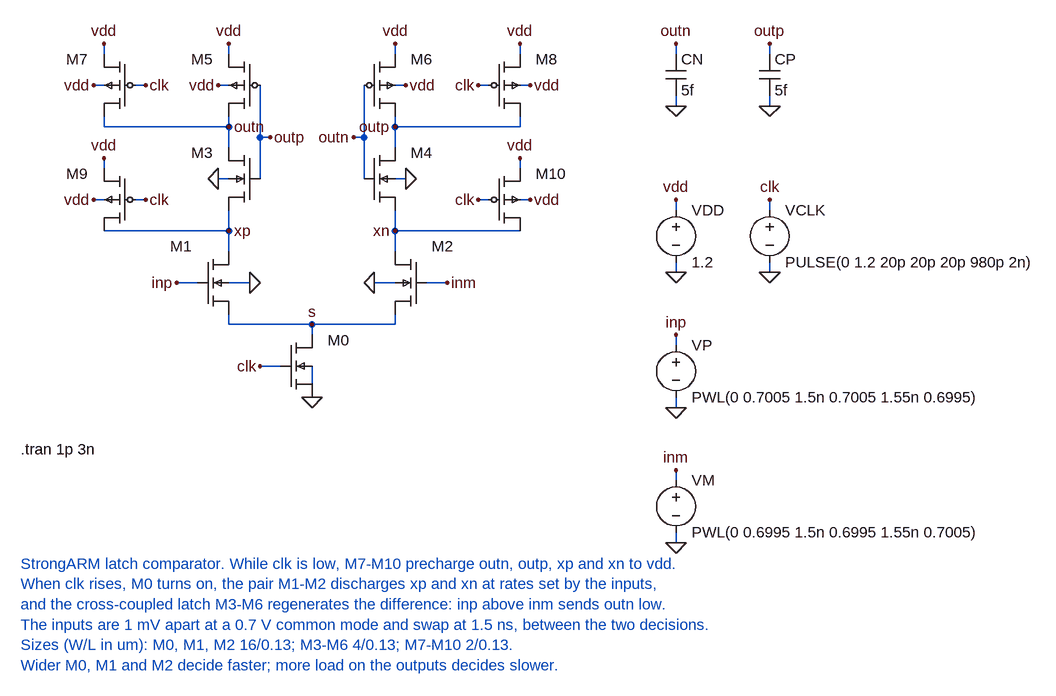
[diagram p0: schematic comparator.asc]
comparator.asc, the LTspice schematic file:
Version 4
SHEET 1 1600 1100
WIRE 368 96 368 80
WIRE 368 144 352 144
WIRE 368 288 352 288
WIRE 624 96 624 80
WIRE 624 144 640 144
WIRE 624 288 640 288
WIRE 368 192 368 240
WIRE 624 192 624 240
WIRE 416 144 416 288
WIRE 576 144 576 288
WIRE 416 224 432 224
WIRE 576 224 560 224
WIRE 320 448 288 448
WIRE 368 448 400 448
WIRE 672 448 704 448
WIRE 624 448 592 448
WIRE 368 336 368 400
WIRE 624 336 624 400
WIRE 368 496 368 512
WIRE 368 512 624 512
WIRE 624 512 624 496
WIRE 448 576 416 576
WIRE 496 528 496 512
WIRE 496 576 496 624
WIRE 176 96 176 80
WIRE 176 144 160 144
WIRE 224 144 240 144
WIRE 176 272 176 256
WIRE 176 320 160 320
WIRE 224 320 240 320
WIRE 816 96 816 80
WIRE 816 144 832 144
WIRE 768 144 752 144
WIRE 816 272 816 256
WIRE 816 320 832 320
WIRE 768 320 752 320
WIRE 176 192 176 208
WIRE 176 208 368 208
WIRE 816 192 816 208
WIRE 816 208 624 208
WIRE 176 368 368 368
WIRE 816 368 624 368
WIRE 1056 96 1056 80
WIRE 1056 160 1056 176
WIRE 1200 96 1200 80
WIRE 1200 160 1200 176
WIRE 1056 336 1056 320
WIRE 1056 416 1056 432
WIRE 1200 336 1200 320
WIRE 1200 416 1200 432
WIRE 1056 544 1056 528
WIRE 1056 624 1056 640
WIRE 1056 752 1056 736
WIRE 1056 832 1056 848
FLAG 368 80 vdd
FLAG 352 144 vdd
FLAG 352 288 0
FLAG 624 80 vdd
FLAG 640 144 vdd
FLAG 640 288 0
FLAG 432 224 outp
FLAG 560 224 outn
FLAG 288 448 inp
FLAG 400 448 0
FLAG 704 448 inm
FLAG 592 448 0
FLAG 416 576 clk
FLAG 496 512 s
FLAG 496 624 0
FLAG 176 80 vdd
FLAG 160 144 vdd
FLAG 240 144 clk
FLAG 176 256 vdd
FLAG 160 320 vdd
FLAG 240 320 clk
FLAG 816 80 vdd
FLAG 832 144 vdd
FLAG 752 144 clk
FLAG 816 256 vdd
FLAG 832 320 vdd
FLAG 752 320 clk
FLAG 368 208 outn
FLAG 624 208 outp
FLAG 368 368 xp
FLAG 624 368 xn
FLAG 1056 80 outn
FLAG 1056 176 0
FLAG 1200 80 outp
FLAG 1200 176 0
FLAG 1056 320 vdd
FLAG 1056 432 0
FLAG 1200 320 clk
FLAG 1200 432 0
FLAG 1056 528 inp
FLAG 1056 640 0
FLAG 1056 736 inm
FLAG 1056 848 0
SYMBOL sg13g2\sg13_lv_pmos 416 96 M0
WINDOW 0 72 8 Left 2
WINDOW 3 0 0 Invisible 2
WINDOW 39 0 0 Invisible 2
SYMATTR InstName M5
SYMATTR SpiceLine w=4u l=0.13u ng=1 m=1
SYMBOL sg13g2\sg13_lv_nmos 416 240 M0
WINDOW 0 72 8 Left 2
WINDOW 3 0 0 Invisible 2
WINDOW 39 0 0 Invisible 2
SYMATTR InstName M3
SYMATTR SpiceLine w=4u l=0.13u ng=1 m=1
SYMBOL sg13g2\sg13_lv_pmos 576 96 R0
WINDOW 0 72 8 Left 2
WINDOW 3 0 0 Invisible 2
WINDOW 39 0 0 Invisible 2
SYMATTR InstName M6
SYMATTR SpiceLine w=4u l=0.13u ng=1 m=1
SYMBOL sg13g2\sg13_lv_nmos 576 240 R0
WINDOW 0 72 8 Left 2
WINDOW 3 0 0 Invisible 2
WINDOW 39 0 0 Invisible 2
SYMATTR InstName M4
SYMATTR SpiceLine w=4u l=0.13u ng=1 m=1
SYMBOL sg13g2\sg13_lv_nmos 320 400 R0
WINDOW 0 -8 -8 Right 2
WINDOW 3 0 0 Invisible 2
WINDOW 39 0 0 Invisible 2
SYMATTR InstName M1
SYMATTR SpiceLine w=16u l=0.13u ng=2 m=1
SYMBOL sg13g2\sg13_lv_nmos 672 400 M0
WINDOW 0 -8 -8 Right 2
WINDOW 3 0 0 Invisible 2
WINDOW 39 0 0 Invisible 2
SYMATTR InstName M2
SYMATTR SpiceLine w=16u l=0.13u ng=2 m=1
SYMBOL sg13g2\sg13_lv_nmos 448 528 R0
WINDOW 0 72 8 Left 2
WINDOW 3 0 0 Invisible 2
WINDOW 39 0 0 Invisible 2
SYMATTR InstName M0
SYMATTR SpiceLine w=16u l=0.13u ng=2 m=1
SYMBOL sg13g2\sg13_lv_pmos 224 96 M0
WINDOW 0 72 8 Left 2
WINDOW 3 0 0 Invisible 2
WINDOW 39 0 0 Invisible 2
SYMATTR InstName M7
SYMATTR SpiceLine w=2u l=0.13u ng=1 m=1
SYMBOL sg13g2\sg13_lv_pmos 224 272 M0
WINDOW 0 72 8 Left 2
WINDOW 3 0 0 Invisible 2
WINDOW 39 0 0 Invisible 2
SYMATTR InstName M9
SYMATTR SpiceLine w=2u l=0.13u ng=1 m=1
SYMBOL sg13g2\sg13_lv_pmos 768 96 R0
WINDOW 0 72 8 Left 2
WINDOW 3 0 0 Invisible 2
WINDOW 39 0 0 Invisible 2
SYMATTR InstName M8
SYMATTR SpiceLine w=2u l=0.13u ng=1 m=1
SYMBOL sg13g2\sg13_lv_pmos 768 272 R0
WINDOW 0 72 8 Left 2
WINDOW 3 0 0 Invisible 2
WINDOW 39 0 0 Invisible 2
SYMATTR InstName M10
SYMATTR SpiceLine w=2u l=0.13u ng=1 m=1
SYMBOL cap 1040 96 R0
SYMATTR InstName CN
SYMATTR Value 5f
SYMBOL cap 1184 96 R0
SYMATTR InstName CP
SYMATTR Value 5f
SYMBOL voltage 1056 320 R0
SYMATTR InstName VDD
SYMATTR Value 1.2
SYMBOL voltage 1200 320 R0
SYMATTR InstName VCLK
SYMATTR Value PULSE(0 1.2 20p 20p 20p 980p 2n)
SYMBOL voltage 1056 528 R0
SYMATTR InstName VP
SYMATTR Value PWL(0 0.7005 1.5n 0.7005 1.55n 0.6995)
SYMBOL voltage 1056 736 R0
SYMATTR InstName VM
SYMATTR Value PWL(0 0.6995 1.5n 0.6995 1.55n 0.7005)
TEXT 48 704 Left 2 !.tran 1p 3n
TEXT 48 880 Left 2 ;StrongARM latch comparator. While clk is low, M7-M10 precharge outn, outp, xp and xn to vdd.\nWhen clk rises, M0 turns on, the pair M1-M2 discharges xp and xn at rates set by the inputs,\nand the cross-coupled latch M3-M6 regenerates the difference: inp above inm sends outn low.\nThe inputs are 1 mV apart at a 0.7 V common mode and swap at 1.5 ns, between the two decisions.\nSizes (W/L in um): M0, M1, M2 16/0.13; M3-M6 4/0.13; M7-M10 2/0.13.\nWider M0, M1 and M2 decide faster; more load on the outputs decides slower.

The netlist it stands for:
* comparator.asc
XM5 outn outp vdd vdd sg13_lv_pmos w=4u l=0.13u ng=1 m=1  ; pins D G S B
XM3 outn outp xp 0 sg13_lv_nmos w=4u l=0.13u ng=1 m=1  ; pins D G S B
XM6 outp outn vdd vdd sg13_lv_pmos w=4u l=0.13u ng=1 m=1  ; pins D G S B
XM4 outp outn xn 0 sg13_lv_nmos w=4u l=0.13u ng=1 m=1  ; pins D G S B
XM1 xp inp s 0 sg13_lv_nmos w=16u l=0.13u ng=2 m=1  ; pins D G S B
XM2 xn inm s 0 sg13_lv_nmos w=16u l=0.13u ng=2 m=1  ; pins D G S B
XM0 s clk 0 0 sg13_lv_nmos w=16u l=0.13u ng=2 m=1  ; pins D G S B
XM7 outn clk vdd vdd sg13_lv_pmos w=2u l=0.13u ng=1 m=1  ; pins D G S B
XM9 xp clk vdd vdd sg13_lv_pmos w=2u l=0.13u ng=1 m=1  ; pins D G S B
XM8 outp clk vdd vdd sg13_lv_pmos w=2u l=0.13u ng=1 m=1  ; pins D G S B
XM10 xn clk vdd vdd sg13_lv_pmos w=2u l=0.13u ng=1 m=1  ; pins D G S B
CN outn 0 5f
CP outp 0 5f
VDD vdd 0 1.2
VCLK clk 0 PULSE(0 1.2 20p 20p 20p 980p 2n)
VP inp 0 PWL(0 0.7005 1.5n 0.7005 1.55n 0.6995)
VM inm 0 PWL(0 0.6995 1.5n 0.6995 1.55n 0.7005)
.tran 1p 3n
* StrongARM latch comparator. While clk is low, M7-M10 precharge outn, outp, xp and xn to vdd.
* When clk rises, M0 turns on, the pair M1-M2 discharges xp and xn at rates set by the inputs,
* and the cross-coupled latch M3-M6 regenerates the difference: inp above inm sends outn low.
* The inputs are 1 mV apart at a 0.7 V common mode and swap at 1.5 ns, between the two decisions.
* Sizes (W/L in um): M0, M1, M2 16/0.13; M3-M6 4/0.13; M7-M10 2/0.13.
* Wider M0, M1 and M2 decide faster; more load on the outputs decides slower.
.backanno
.end